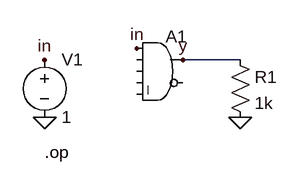
[diagram p0: schematic adevice_and_open_input.asc]
adevice_and_open_input.asc, the LTspice schematic file:
Version 4
SHEET 1 880 680
WIRE 128 112 208 112
FLAG -64 112 in
FLAG -64 192 0
FLAG 64 96 in
FLAG 128 112 y
FLAG 208 192 0
SYMBOL voltage -64 96 R0
SYMATTR InstName V1
SYMATTR Value 1
SYMBOL Digital\and 96 64 R0
SYMATTR InstName A1
SYMBOL res 192 96 R0
SYMATTR InstName R1
SYMATTR Value 1k
TEXT -64 240 Left 2 !.op

The netlist it stands for:
* adevice_and_open_input.asc
V1 in 0 1
A1 in 0 0 0 0 0 y 0 AND
R1 y 0 1k
.op
.backanno
.end